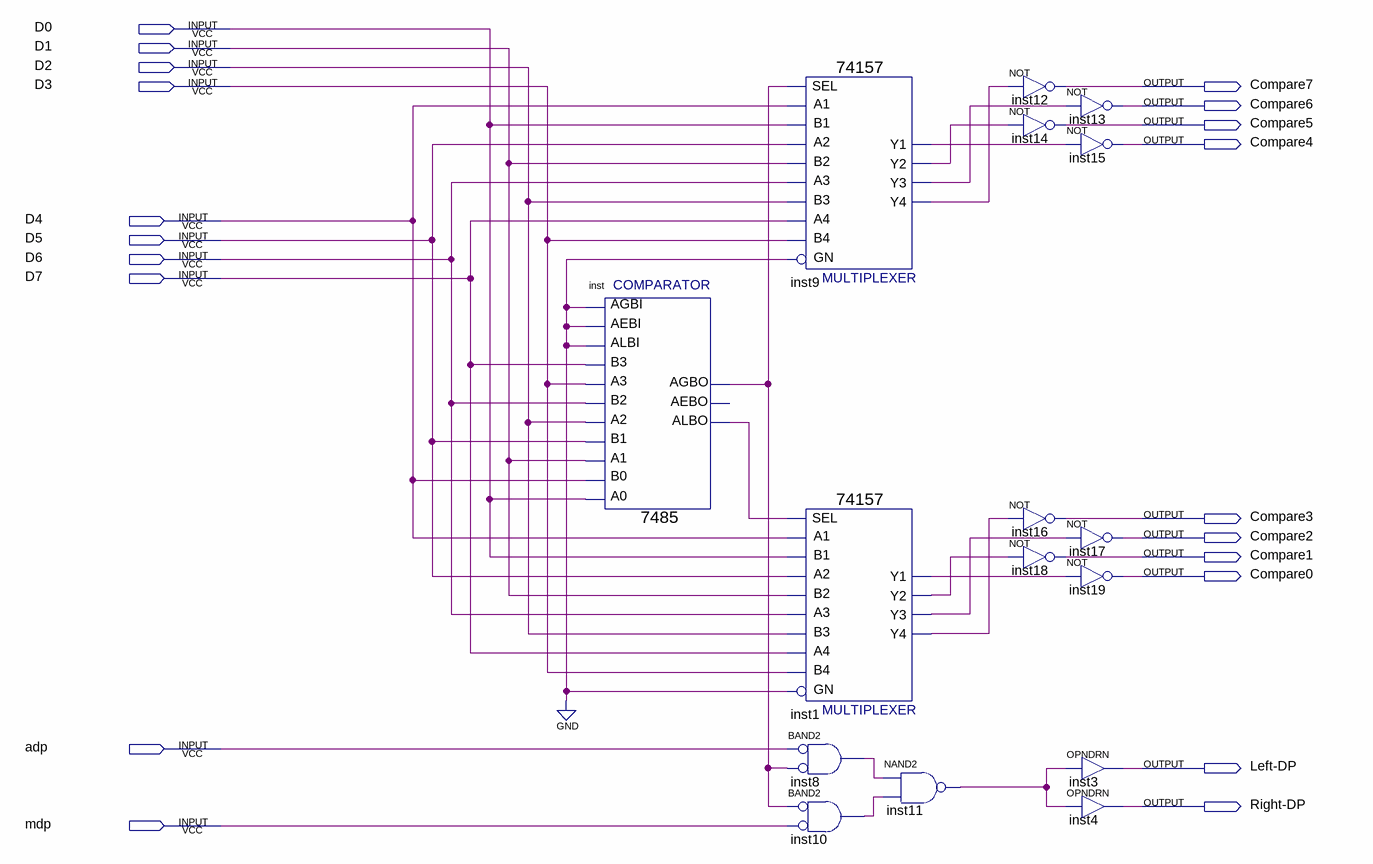
[diagram p0: schematic sheet]
// Quartus schematic maxmin.bdf as structural Verilog: 16 symbols, 20 pins
module maxmin (
  input  D0,
  input  D1,
  input  D2,
  input  D3,
  input  D4,
  input  D5,
  input  D6,
  input  D7,
  input  adp,
  input  mdp,
  output Compare7,
  output Compare6,
  output Compare5,
  output Compare4,
  output Compare3,
  output Compare2,
  output Compare1,
  output Compare0,
  output \Left-DP ,
  output \Right-DP 
);

  wire inst1_y1, inst1_y2, inst1_y3, inst1_y4, inst8_out, inst9_y1, inst9_y2, inst9_y3, inst9_y4, inst10_out,
       inst11_out, inst_agbo, inst_albo;

  \7485  inst (
    .A3(D3), .B2(D6), .A2(D2), .AEBI(1'b0), .AGBI(1'b0), .ALBI(1'b0), .A0(D0), .B0(D4), .B3(D7), .A1(D1),
    .B1(D5), .ALBO(inst_albo), .AGBO(inst_agbo));  // open: AEBO
  \74157  inst9 (
    .A1(D4), .B1(D0), .SEL(inst_agbo), .B2(D1), .A3(D6), .B3(D2), .A2(D5), .B4(D3), .GN(1'b0), .A4(D7),
    .Y2(inst9_y2), .Y1(inst9_y1), .Y4(inst9_y4), .Y3(inst9_y3));
  \74157  inst1 (
    .A1(D4), .B1(D0), .SEL(inst_albo), .B2(D1), .A3(D6), .B3(D2), .A2(D5), .B4(D3), .GN(1'b0), .A4(D7),
    .Y2(inst1_y2), .Y1(inst1_y1), .Y4(inst1_y4), .Y3(inst1_y3));
  and inst8 (inst8_out, ~adp, ~inst_agbo);  // BAND2
  and inst10 (inst10_out, ~inst_agbo, ~mdp);  // BAND2
  nand inst11 (inst11_out, inst8_out, inst10_out);
  not inst12 (Compare7, inst9_y4);
  not inst13 (Compare6, inst9_y3);
  not inst14 (Compare5, inst9_y2);
  not inst15 (Compare4, inst9_y1);
  not inst16 (Compare3, inst1_y4);
  not inst17 (Compare2, inst1_y3);
  not inst18 (Compare1, inst1_y2);
  not inst19 (Compare0, inst1_y1);
  OPNDRN inst3 (.IN(inst11_out), .OUT(\Left-DP ));
  OPNDRN inst4 (.IN(inst11_out), .OUT(\Right-DP ));
endmodule
